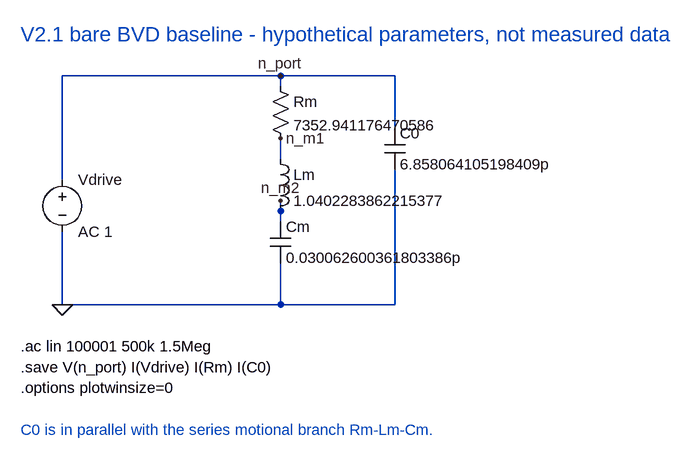
[diagram p0: schematic V2_1_BARE_BVD_Q800.asc]
V2_1_BARE_BVD_Q800.asc, the LTspice schematic file:
Version 4.1
SHEET 1 1280 800
WIRE 464 128 128 128
WIRE 640 128 464 128
WIRE 464 144 464 128
WIRE 640 208 640 128
WIRE 464 256 464 224
WIRE 128 288 128 128
WIRE 464 336 464 320
WIRE 464 352 464 336
WIRE 128 480 128 368
WIRE 464 480 464 416
WIRE 464 480 128 480
WIRE 640 480 640 272
WIRE 640 480 464 480
FLAG 128 480 0
FLAG 464 128 n_port
FLAG 464 224 n_m1
FLAG 464 320 n_m2
SYMBOL voltage 128 272 R0
WINDOW 123 24 124 Left 2
WINDOW 39 0 0 Left 0
SYMATTR InstName Vdrive
SYMATTR Value AC 1
SYMBOL res 448 128 R0
SYMATTR InstName Rm
SYMATTR Value 7352.941176470586
SYMBOL ind 448 240 R0
SYMATTR InstName Lm
SYMATTR Value 1.0402283862215377
SYMBOL cap 448 352 R0
SYMATTR InstName Cm
SYMATTR Value 0.030062600361803386p
SYMBOL cap 624 208 R0
SYMATTR InstName C0
SYMATTR Value 6.858064105198409p
TEXT 64 544 Left 2 !.ac lin 100001 500k 1.5Meg
TEXT 64 576 Left 2 !.save V(n_port) I(Vdrive) I(Rm) I(C0)
TEXT 64 608 Left 2 !.options plotwinsize=0
TEXT 64 64 Left 3 ;V2.1 bare BVD baseline - hypothetical parameters, not measured data
TEXT 64 672 Left 2 ;C0 is in parallel with the series motional branch Rm-Lm-Cm.

The netlist it stands for:
* V2_1_BARE_BVD_Q800.asc
Vdrive n_port 0 AC 1
Rm n_port n_m1 7352.941176470586
Lm n_m1 n_m2 1.0402283862215377
Cm n_m2 0 0.030062600361803386p
C0 n_port 0 6.858064105198409p
.ac lin 100001 500k 1.5Meg
.save V(n_port) I(Vdrive) I(Rm) I(C0)
.options plotwinsize=0
* V2.1 bare BVD baseline - hypothetical parameters, not measured data
* C0 is in parallel with the series motional branch Rm-Lm-Cm.
.backanno
.end